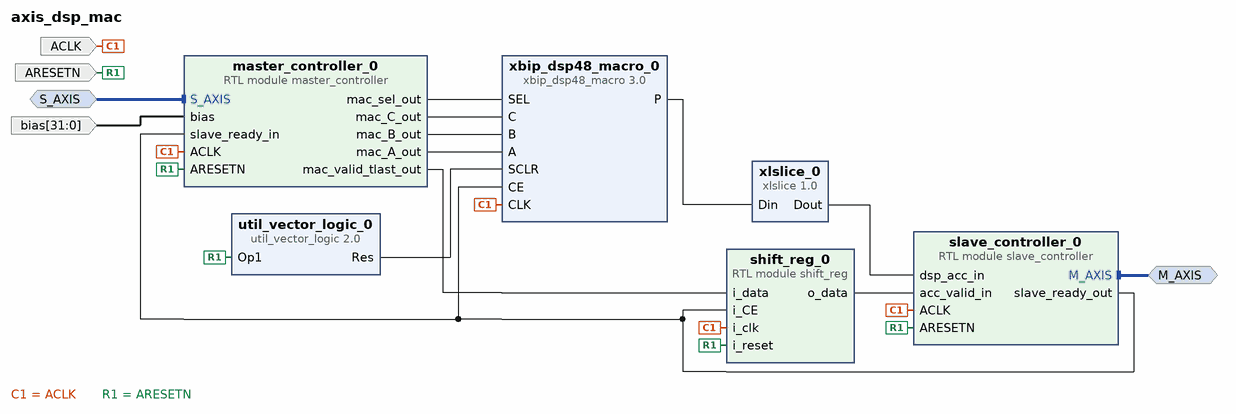
[diagram p0: block diagram of the top level]
# Vivado block design axis_dsp_mac, xc7z020clg484-1, Vivado 2020.1
create_bd_design axis_dsp_mac

create_bd_intf_port -mode Slave -vlnv xilinx.com:interface:axis_rtl:1.0 S_AXIS
set_property -dict [list \
  CONFIG.TDATA_NUM_BYTES 2 \
  CONFIG.TDEST_WIDTH 0 \
  CONFIG.TID_WIDTH 0 \
  CONFIG.TUSER_WIDTH 0 \
  CONFIG.HAS_TREADY 1 \
  CONFIG.HAS_TSTRB 0 \
  CONFIG.HAS_TKEEP 0 \
  CONFIG.HAS_TLAST 1 \
  CONFIG.LAYERED_METADATA undef \
] [get_bd_intf_ports S_AXIS]
create_bd_intf_port -mode Master -vlnv xilinx.com:interface:axis_rtl:1.0 M_AXIS
create_bd_port -dir I -type clk ACLK
set_property -dict {CONFIG.ASSOCIATED_BUSIF M_AXIS:S_AXIS CONFIG.ASSOCIATED_RESET ARESETN} [get_bd_ports ACLK]
create_bd_port -dir I -type rst ARESETN
create_bd_port -dir I -from 31 -to 0 bias

create_bd_cell -type module -reference shift_reg shift_reg_0
create_bd_cell -type ip -vlnv xilinx.com:ip:xbip_dsp48_macro:3.0 xbip_dsp48_macro_0
set_property -dict [list \
  CONFIG.a_binarywidth 0 \
  CONFIG.a_width 8 \
  CONFIG.areg_3 true \
  CONFIG.areg_4 true \
  CONFIG.b_binarywidth 0 \
  CONFIG.b_width 8 \
  CONFIG.breg_3 true \
  CONFIG.breg_4 true \
  CONFIG.c_binarywidth 0 \
  CONFIG.c_width 32 \
  CONFIG.concat_binarywidth 0 \
  CONFIG.concat_width 48 \
  CONFIG.creg_3 true \
  CONFIG.creg_4 true \
  CONFIG.creg_5 true \
  CONFIG.d_width 18 \
  CONFIG.has_ce true \
  CONFIG.has_sclr true \
  CONFIG.instruction1 {A*B+P} \
  CONFIG.instruction2 {A*B+C} \
  CONFIG.mreg_5 true \
  CONFIG.opreg_3 true \
  CONFIG.opreg_4 true \
  CONFIG.opreg_5 true \
  CONFIG.pcin_binarywidth 0 \
  CONFIG.preg_6 true \
] [get_bd_cells xbip_dsp48_macro_0]
create_bd_cell -type ip -vlnv xilinx.com:ip:xlslice:1.0 xlslice_0
set_property -dict {CONFIG.DIN_FROM 31 CONFIG.DIN_WIDTH 48 CONFIG.DOUT_WIDTH 32} [get_bd_cells xlslice_0]
create_bd_cell -type module -reference slave_controller slave_controller_0
create_bd_cell -type ip -vlnv xilinx.com:ip:util_vector_logic:2.0 util_vector_logic_0
set_property -dict {CONFIG.C_OPERATION not CONFIG.C_SIZE 1} [get_bd_cells util_vector_logic_0]
create_bd_cell -type module -reference master_controller master_controller_0

# ---- connections ----

connect_bd_intf_net [get_bd_intf_ports S_AXIS] [get_bd_intf_pins master_controller_0/S_AXIS]
connect_bd_intf_net [get_bd_intf_ports M_AXIS] [get_bd_intf_pins slave_controller_0/M_AXIS]
connect_bd_net [get_bd_pins xbip_dsp48_macro_0/P] [get_bd_pins xlslice_0/Din]
connect_bd_net [get_bd_pins xlslice_0/Dout] [get_bd_pins slave_controller_0/dsp_acc_in]
connect_bd_net [get_bd_ports ACLK] \
  [get_bd_pins xbip_dsp48_macro_0/CLK] [get_bd_pins shift_reg_0/i_clk] [get_bd_pins slave_controller_0/ACLK] \
  [get_bd_pins master_controller_0/ACLK]
connect_bd_net [get_bd_ports ARESETN] \
  [get_bd_pins shift_reg_0/i_reset] [get_bd_pins slave_controller_0/ARESETN] [get_bd_pins util_vector_logic_0/Op1] \
  [get_bd_pins master_controller_0/ARESETN]
connect_bd_net [get_bd_pins slave_controller_0/slave_ready_out] \
  [get_bd_pins xbip_dsp48_macro_0/CE] [get_bd_pins shift_reg_0/i_CE] [get_bd_pins master_controller_0/slave_ready_in]
connect_bd_net [get_bd_pins master_controller_0/mac_valid_tlast_out] [get_bd_pins shift_reg_0/i_data]
connect_bd_net [get_bd_pins shift_reg_0/o_data] [get_bd_pins slave_controller_0/acc_valid_in]
connect_bd_net [get_bd_pins master_controller_0/mac_sel_out] [get_bd_pins xbip_dsp48_macro_0/SEL]
connect_bd_net [get_bd_pins master_controller_0/mac_C_out] [get_bd_pins xbip_dsp48_macro_0/C]
connect_bd_net [get_bd_pins master_controller_0/mac_B_out] [get_bd_pins xbip_dsp48_macro_0/B]
connect_bd_net [get_bd_pins master_controller_0/mac_A_out] [get_bd_pins xbip_dsp48_macro_0/A]
connect_bd_net [get_bd_ports bias] [get_bd_pins master_controller_0/bias]
connect_bd_net [get_bd_pins util_vector_logic_0/Res] [get_bd_pins xbip_dsp48_macro_0/SCLR]

validate_bd_design
save_bd_design
